# Altium schematic sheet Sheet1.SchDoc
size A2
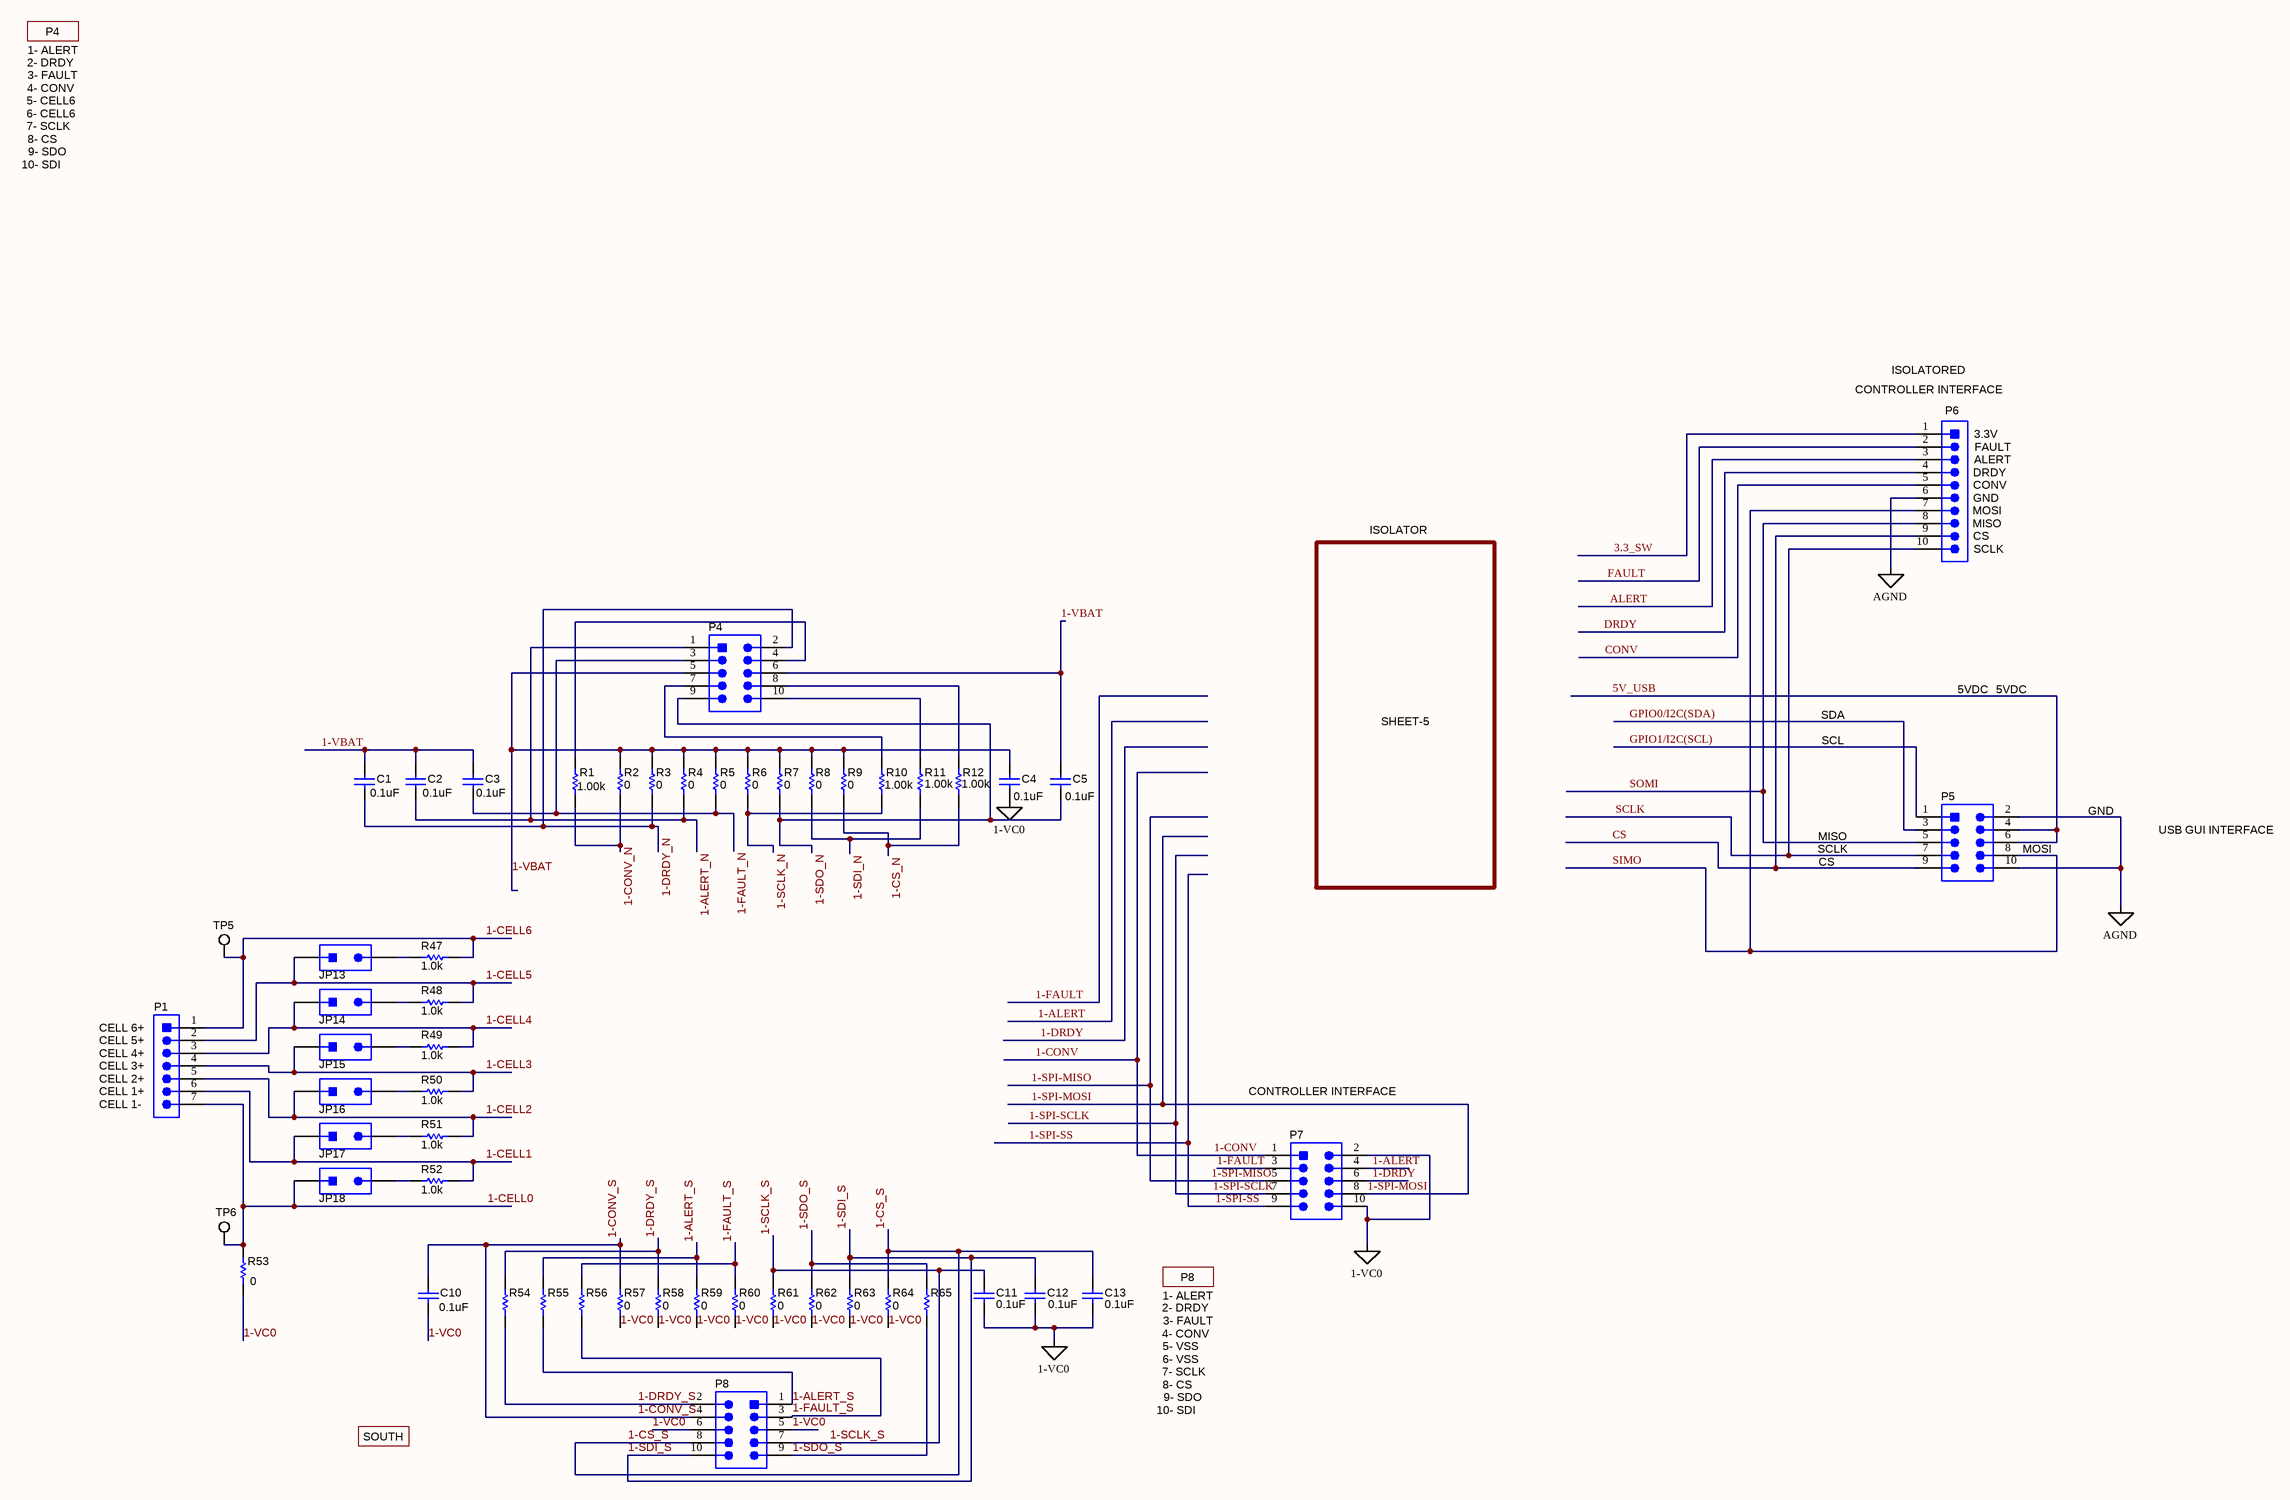
[diagram p0: Sheet1.SchDoc]

## Parts
C1  value 0.1uF  [0603[]]  (hidden comment: 06035C104KAT2A)
C2  value 0.1uF  [0603[]]  (hidden comment: 06035C104KAT2A)
C3  value 0.1uF  [0603[]]  (hidden comment: 06035C104KAT2A)
C4  value 0.1uF  [0603[]]  (hidden comment: 06035C104KAT2A)
C5  value 0.1uF  [0603[]]  (hidden comment: 06035C104KAT2A)
C10  value 0.1uF  [0603[]]  (hidden comment: 06035C104KAT2A)
C11  value 0.1uF  [0603[]]  (hidden comment: 06035C104KAT2A)
C12  value 0.1uF  [0603[]]  (hidden comment: 06035C104KAT2A)
C13  value 0.1uF  [0603[]]  (hidden comment: 06035C104KAT2A)
JP13  PEC02SAAN  [CONN_PEC02SAAN]  (value not drawn)
JP14  PEC02SAAN  [CONN_PEC02SAAN]  (value not drawn)
JP15  PEC02SAAN  [CONN_PEC02SAAN]  (value not drawn)
JP16  PEC02SAAN  [CONN_PEC02SAAN]  (value not drawn)
JP17  PEC02SAAN  [CONN_PEC02SAAN]  (value not drawn)
JP18  PEC02SAAN  [CONN_PEC02SAAN]  (value not drawn)
P1  395021007  [Molex_395021007]  (value not drawn)
P4  5103308-1  [CONN_5103308-1]  (value not drawn)
P5  5103308-1  [CONN_5103308-1]  (value not drawn)
P6  HPM-10-05-T-S  [Samtec_HPM-10-05-T-S]  (value not drawn)
P7  5103308-1  [CONN_5103308-1]  (value not drawn)
P8  5103308-1  [CONN_5103308-1]  (value not drawn)
R1  value 1.00k  [1206[]]  (hidden comment: CRCW12061K00FKEA)
R2  ValueDisplayed: 0  [0603[]]  (hidden comment: CRCW06030000Z0EA)
R3  ValueDisplayed: 0  [0603[]]  (hidden comment: CRCW06030000Z0EA)
R4  ValueDisplayed: 0  [0603[]]  (hidden comment: CRCW06030000Z0EA)
R5  ValueDisplayed: 0  [0603[]]  (hidden comment: CRCW06030000Z0EA)
R6  ValueDisplayed: 0  [0603[]]  (hidden comment: CRCW06030000Z0EA)
R7  ValueDisplayed: 0  [0603[]]  (hidden comment: CRCW06030000Z0EA)
R8  ValueDisplayed: 0  [0603[]]  (hidden comment: CRCW06030000Z0EA)
R9  ValueDisplayed: 0  [0603[]]  (hidden comment: CRCW06030000Z0EA)
R10  value 1.00k  [1206[]]  (hidden comment: CRCW12061K00FKEA)
R11  value 1.00k  [1206[]]  (hidden comment: CRCW12061K00FKEA)
R12  value 1.00k  [1206[]]  (hidden comment: CRCW12061K00FKEA)
R47  ValueDisplayed: 1.0k  [0603[]]  (hidden comment: CRCW06031K00JNEA)
R48  ValueDisplayed: 1.0k  [0603[]]  (hidden comment: CRCW06031K00JNEA)
R49  ValueDisplayed: 1.0k  [0603[]]  (hidden comment: CRCW06031K00JNEA)
R50  ValueDisplayed: 1.0k  [0603[]]  (hidden comment: CRCW06031K00JNEA)
R51  ValueDisplayed: 1.0k  [0603[]]  (hidden comment: CRCW06031K00JNEA)
R52  ValueDisplayed: 1.0k  [0603[]]  (hidden comment: CRCW06031K00JNEA)
R53  ValueDisplayed: 0  [1206[]]  (hidden comment: CRCW12060000Z0EA)
R54  CRCW12061K00FKEA  [1206[]]  (value not drawn)
R55  CRCW12061K00FKEA  [1206[]]  (value not drawn)
R56  CRCW12061K00FKEA  [1206[]]  (value not drawn)
R57  ValueDisplayed: 0  [0603[]]  (hidden comment: CRCW06031K00JNEA)
R58  ValueDisplayed: 0  [0603[]]  (hidden comment: CRCW06031K00JNEA)
R59  ValueDisplayed: 0  [0603[]]  (hidden comment: CRCW06031K00JNEA)
R60  ValueDisplayed: 0  [0603[]]  (hidden comment: CRCW06031K00JNEA)
R61  ValueDisplayed: 0  [0603[]]  (hidden comment: CRCW06031K00JNEA)
R62  ValueDisplayed: 0  [0603[]]  (hidden comment: CRCW06031K00JNEA)
R63  ValueDisplayed: 0  [0603[]]  (hidden comment: CRCW06031K00JNEA)
R64  ValueDisplayed: 0  [0603[]]  (hidden comment: CRCW06031K00JNEA)
R65  CRCW12061K00FKEA  [1206[]]  (value not drawn)
TP5  5015  [Testpoint_Keystone_Miniature]  (value not drawn)
TP6  5015  [Testpoint_Keystone_Miniature]  (value not drawn)

## Nets
1-VC0: C4.2 C10.2 C11.2 C12.2 C13.2 P7.2 P7.10 P8.5 P8.6 R53.1 R57.1 R58.1 R59.1 R60.1 R61.1 R62.1 R63.1 R64.1
AGND: P5.2 P5.10 P6.6
1-ALERT: P7.4
1-ALERT_N: C2.2 P4.1 R4.1
1-ALERT_S: P8.1 R55.1 R55.2 R59.2
1-CELL0: JP18.1 P1.7 R53.2 TP6.1
1-CELL1: JP17.1 P1.6 R52.2
1-CELL2: JP16.1 P1.5 R51.2
1-CELL3: JP15.1 P1.4 R50.2
1-CELL4: JP14.1 P1.3 R49.2
1-CELL5: JP13.1 P1.2 R48.2
1-CELL6: P1.1 R47.2 TP5.1
1-CONV: P7.1
1-CONV_N: R1.1 R2.1
1-CONV_S: C10.1 P8.4 R57.2
1-CS_N: R9.1 R12.1
1-CS_S: C13.1 P8.8 R64.2
1-DRDY: P7.6
1-DRDY_N: C1.2 P4.2 R3.1
1-DRDY_S: P8.2 R54.1 R54.2 R58.2
1-FAULT: P7.3
1-FAULT_N: C3.2 P4.3 R5.1
1-FAULT_S: P8.3 R56.1 R56.2 R60.2
1-SCLK_N: R6.1 R10.1
1-SCLK_S: C11.1 P8.7 R61.2
1-SDI_N: R8.1 R11.1
1-SDI_S: C12.1 P8.10 R63.2
1-SDO_N: C5.2 P4.9 R7.1
1-SDO_S: P8.9 R62.2 R65.1 R65.2
1-SPI-MISO: P7.5
1-SPI-MOSI: P7.8
1-SPI-SCLK: P7.7
1-SPI-SS: P7.9
1-VBAT: C1.1 C2.1 C3.1 C4.1 C5.1 P4.5 P4.6 R2.2 R3.2 R4.2 R5.2 R6.2 R7.2 R8.2 R9.2
3.3_SW: P6.1
5V_USB: P5.4 P5.6
ALERT: P6.3
CONV: P6.5
CS: P5.9 P6.9
DRDY: P6.4
FAULT: P6.2
GPIO0/I2C(SDA): P5.3
GPIO1/I2C(SCL): P5.1
SCLK: P5.7 P6.10
SIMO: P5.8 P6.7
SOMI: P5.5 P6.8
NetJP13_2: JP13.2 R47.1
NetJP14_2: JP14.2 R48.1
NetJP15_2: JP15.2 R49.1
NetJP16_2: JP16.2 R50.1
NetJP17_2: JP17.2 R51.1
NetJP18_2: JP18.2 R52.1
NetP4_4: P4.4 R1.2
NetP4_7: P4.7 R10.2
NetP4_8: P4.8 R12.2
NetP4_10: P4.10 R11.2

## Notes on the sheet
- 2- DRDY
- 1- ALERT
- P4
- 7- SCLK
- 4- CONV
- 5- CELL6
- 6- CELL6
- 3- FAULT
- 10- SDI
- 8- CS
- 9- SDO
- ISOLATORED
- (near P6) CONTROLLER INTERFACE
- (near P6) 3.3V
- (near P6) FAULT
- (near P6) GND
- (near P6) DRDY
- (near P6) CONV
- (near P6) ALERT
- ISOLATOR
- (near P6) CS
- (near P6) MOSI
- (near P6) MISO
- (near P6) SCLK
- 5VDC
- SHEET-5
- SCL
- SDA
- GND
- USB GUI INTERFACE
- CS
- SCLK
- MISO
- (near P5) MOSI
- (near P1) CELL 2+
- (near P1) CELL 3+
- (near P1) CELL 4+
- (near P1) CELL 5+
- (near P1) CELL 6+
- (near P1) CELL 1-
- (near P1) CELL 1+
- CONTROLLER INTERFACE
- P8
- 5- VSS
- 6- VSS
- SOUTH

## Library data of the parts
C1-C5 C10-C13 = 06035C104KAT2A: CAP, CERM, 0.1 µF, 50 V, +/- 10%, X7R, 0603; Manufacturer: AVX; Polarized: N; CompType: Capacitor; ValueDisplayed: 0.1µF; U/M: EA; Cap_F: 0.0000001; Tolerance_%: 10; Value1: Unknown; VDC_V: 50; Value2: 50V; TaMin_C: -55; TaMax_C: 125; Cap_Case: 0603; SymbolVersion: 2008-07-09; PartNumber: 06035C104KAT2A; PackageReference: 0603; RoHS: Y; MountType: SMT; Technology: Ceramic; TempCo: X7R; Published: 2008-06-19; Publisher: Texas Instruments; LatestRevisionDate: 2015-07-09; ComponentLink1Description: Datasheet link; ComponentLink1URL: http://www.avx.com/docs/Catalogs/cx7r.pdf; Supplier 1: Digi-Key; Supplier Part Number 1: 478-5052-1-ND; Supplier 2: Mouser; Supplier Part Number 2: 581-06035C104KAT2A; Supplier 3: Farnell; Supplier Part Number 3: 1301804
JP13-JP18 = PEC02SAAN: Header, 100mil, 2x1, Tin, TH; Manufacturer: Sullins Connector Solutions; SymbolCreator: a0412235; U/M: EA; SymbolVersion: 2013-10-31; PartNumber: PEC02SAAN; ClassName: Header; PackageReference: Header, 2 PIN, 100mil, Tin; CompType: Header; RoHS: Y; MountType: TH; ComponentLink1Description: Datasheet Link; ComponentLink1URL: http://www.sullinscorp.com/catalogs/97_Page78-79_HEADER_.100_2.54mm_MALE_BREAKAWAY.pdf; Publisher: Texas Instruments; LatestRevisionDate: 2014-11-19; Supplier 1: Digi-Key; Supplier Part Number 1: S1012E-02-ND
P1 = 395021007: Header(Shrouded), 3.5mm, 7x1,  R/A, TH; Manufacturer: Molex; SymbolCreator: a0411947; U/M: EA; SymbolVersion: 2013-12-22; PartNumber: 395021007; PackageReference: Header(Shrouded), 3.5mm, 7x1, R/A, TH; CompType: Header; RoHS: Y; MountType: TH; ComponentLink1Description: Datasheet Link; ComponentLink1URL: http://www.molex.com/pdm_docs/sd/395021002_sd.pdf; Publisher: Texas Instruments; LatestRevisionDate: 2015-06-30; Supplier 1: Digi-Key; Supplier Part Number 1: WM7775-ND; Supplier 2: Mouser; Supplier Part Number 2: 538-39502-1007
P4 P5 P7 P8 = 5103308-1: Header (shrouded), 100mil, 5x2, Gold, TH; Manufacturer: TE Connectivity; SymbolCreator: a0412235; U/M: EA; SymbolVersion: 2013-12-22; PartNumber: 5103308-1; PackageReference: 5x2 Shrouded header; CompType: Header; RoHS: Y; MountType: TH; ComponentLink1Description: Datasheet Link; ComponentLink1URL: http://www.te.com/commerce/DocumentDelivery/DDEController?Action=showdoc&DocId=Customer+Drawing%7F5103308%7FE%7Fpdf%7FEnglish%7FENG_CD_5103308_E.pdf%7F5103308-1; Publisher: Texas Instruments; LatestRevisionDate: 2014-11-19; Supplier 1: Digi-Key; Supplier Part Number 1: A33159-ND; Supplier 2: Mouser; Supplier Part Number 2: 571-5103308-1; Supplier 3: Farnell; Supplier Part Number 3: 1772835
P6 = HPM-10-05-T-S: Header, 5.08mm, 10x1, Tin, TH; Manufacturer: Samtec; SymbolCreator: a0412235; U/M: EA; SymbolVersion: 2013-12-22; PartNumber: HPM-10-05-T-S; PackageReference: Header, 5.08mm, 10x1, TH; ClassName: Header; CompType: Header; RoHS: Y; MountType: TH; ComponentLink1Description: Datasheet Link; ComponentLink1URL: https://www.samtec.com/ftppub/pdf/HPM.PDF; Publisher: Texas Instruments; LatestRevisionDate: 2015-08-24; Supplier 1: Digi-Key; Supplier Part Number 1: HPM-10-05-T-S-ND
R1 R10-R12 = CRCW12061K00FKEA: RES, 1.00 k, 1%, 0.25 W, 1206; Manufacturer: Vishay-Dale; CompType: Resistor; Res_ohm: 1000; Value_Code: 1k00; Tolerance_%: 1; Power_W: 0.25; Value2: 0.25W; VDC_V: 200; TempCo: 100 ppm/C; EIA_Code: E96; U/M: EA; SymbolVersion: 2009-05-29; PartNumber: CRCW12061K00FKEA; PackageReference: 1206; RoHS: Y; Value1: 1%; MountType: SMT; Technology: Thick Film; Published: 2008-06-26; Publisher: Texas Instruments; LatestRevisionDate: 2015-06-11; ComponentLink1Description: Datasheet link; ComponentLink1URL: http://www.vishay.com/docs/20035/dcrcwe3.pdf; Supplier 1: Digi-Key; Supplier Part Number 1: 541-1.00KFCT-ND; Supplier 2: Mouser; Supplier Part Number 2: 71-CRCW1206-1.0K-E3; Supplier 3: Farnell; Supplier Part Number 3: 1469965; ValueDisplayed: 1.00k
R2-R9 = CRCW06030000Z0EA: RES, 0, 5%, 0.1 W, 0603; Manufacturer: Vishay-Dale; CompType: Resistor; Value: 0; Value_Code: 0000; Tolerance_%: 5; Power_W: 0.1; Value2: 0.1W; VDC_V: 75; TempCo: 200 ppm/C; EIA_Code: E24; U/M: EA; SymbolVersion: 2009-05-29; PartNumber: CRCW06030000Z0EA; PackageReference: 0603; RoHS: Y; Res_ohm: 0; Value1: 5%; MountType: SMT; Technology: Thick Film; Published: 2008-06-26; Publisher: Texas Instruments; LatestRevisionDate: 2015-06-13; ComponentLink1Description: Datasheet link; ComponentLink1URL: http://www.vishay.com/docs/20035/dcrcwe3.pdf; Supplier 1: Digi-Key; Supplier Part Number 1: 541-0.0GCT-ND; Supplier 2: Mouser; Supplier Part Number 2: 71-CRCW0603-0-E3; Supplier 3: Farnell; Supplier Part Number 3: 1469739
R47-R52 R57-R64 = CRCW06031K00JNEA: RES, 1.0 k, 5%, 0.1 W, 0603; Manufacturer: Vishay-Dale; CompType: Resistor; Value: 1.0k; Res_ohm: 1000; Value_Code: 1k00; Tolerance_%: 5; Power_W: 0.1; Value2: 0.1W; VDC_V: 75; TempCo: 200 ppm/C; EIA_Code: E24; U/M: EA; SymbolVersion: 2009-05-29; PartNumber: CRCW06031K00JNEA; PackageReference: 0603; RoHS: Y; Value1: 5%; MountType: SMT; Technology: Thick Film; Published: 2008-06-26; Publisher: Texas Instruments; LatestRevisionDate: 2015-06-13; ComponentLink1Description: Datasheet link; ComponentLink1URL: http://www.vishay.com/docs/20035/dcrcwe3.pdf; Supplier 1: Digi-Key; Supplier Part Number 1: 541-1.0KGCT-ND; Supplier 2: Mouser; Supplier Part Number 2: 71-CRCW0603J-1.0K-E3; Supplier 3: Farnell; Supplier Part Number 3: 1652851
R53 = CRCW12060000Z0EA: RES, 0, 5%, 0.25 W, 1206; Manufacturer: Vishay-Dale; CompType: Resistor; Value: 0; Value_Code: 0000; Tolerance_%: 5; Power_W: 0.25; Value2: 0.25W; VDC_V: 200; TempCo: 200 ppm/C; EIA_Code: E24; U/M: EA; SymbolVersion: 2009-05-29; PartNumber: CRCW12060000Z0EA; PackageReference: 1206; RoHS: Y; Res_ohm: 0; Value1: 5%; MountType: SMT; Technology: Thick Film; Published: 2008-06-26; Publisher: Texas Instruments; LatestRevisionDate: 2015-06-11; ComponentLink1Description: Datasheet link; ComponentLink1URL: http://www.vishay.com/docs/20035/dcrcwe3.pdf; Supplier 1: Digi-Key; Supplier Part Number 1: 541-0.0ECT-ND; Supplier 2: Mouser; Supplier Part Number 2: 71-CRCW1206-0-E3; Supplier 3: Farnell; Supplier Part Number 3: 1469963
R54-R56 R65 = CRCW12061K00FKEA: RES, 1.00 k, 1%, 0.25 W, 1206; Manufacturer: Vishay-Dale; CompType: Resistor; Value: 1.00k; Res_ohm: 1000; Value_Code: 1k00; Tolerance_%: 1; Power_W: 0.25; Value2: 0.25W; VDC_V: 200; TempCo: 100 ppm/C; EIA_Code: E96; U/M: EA; SymbolVersion: 2009-05-29; PartNumber: CRCW12061K00FKEA; PackageReference: 1206; RoHS: Y; Value1: 1%; MountType: SMT; Technology: Thick Film; Published: 2008-06-26; Publisher: Texas Instruments; LatestRevisionDate: 2015-06-11; ComponentLink1Description: Datasheet link; ComponentLink1URL: http://www.vishay.com/docs/20035/dcrcwe3.pdf; Supplier 1: Digi-Key; Supplier Part Number 1: 541-1.00KFCT-ND; Supplier 2: Mouser; Supplier Part Number 2: 71-CRCW1206-1.0K-E3; Supplier 3: Farnell; Supplier Part Number 3: 1469965; ValueDisplayed: 1.00k
TP5 TP6 = 5015: Test Point, Miniature, SMT; Manufacturer: Keystone; CompType: Test Point Loop; U/M: EA; SymbolVersion: 2008-07-10; PackageReference: Testpoint_Keystone_Miniature; Publisher: Texas Instruments; LatestRevisionDate: 2015-07-28; PartNumber: 5015; RoHS: Y; MountType: SMT; ComponentLink1Description: Datasheet Link; ComponentLink1URL: http://www.keyelco.com/userAssets/store/files/5015.PDF; Value: SMT; Supplier 1: Digi-Key; Supplier Part Number 1: 36-5015CT-ND